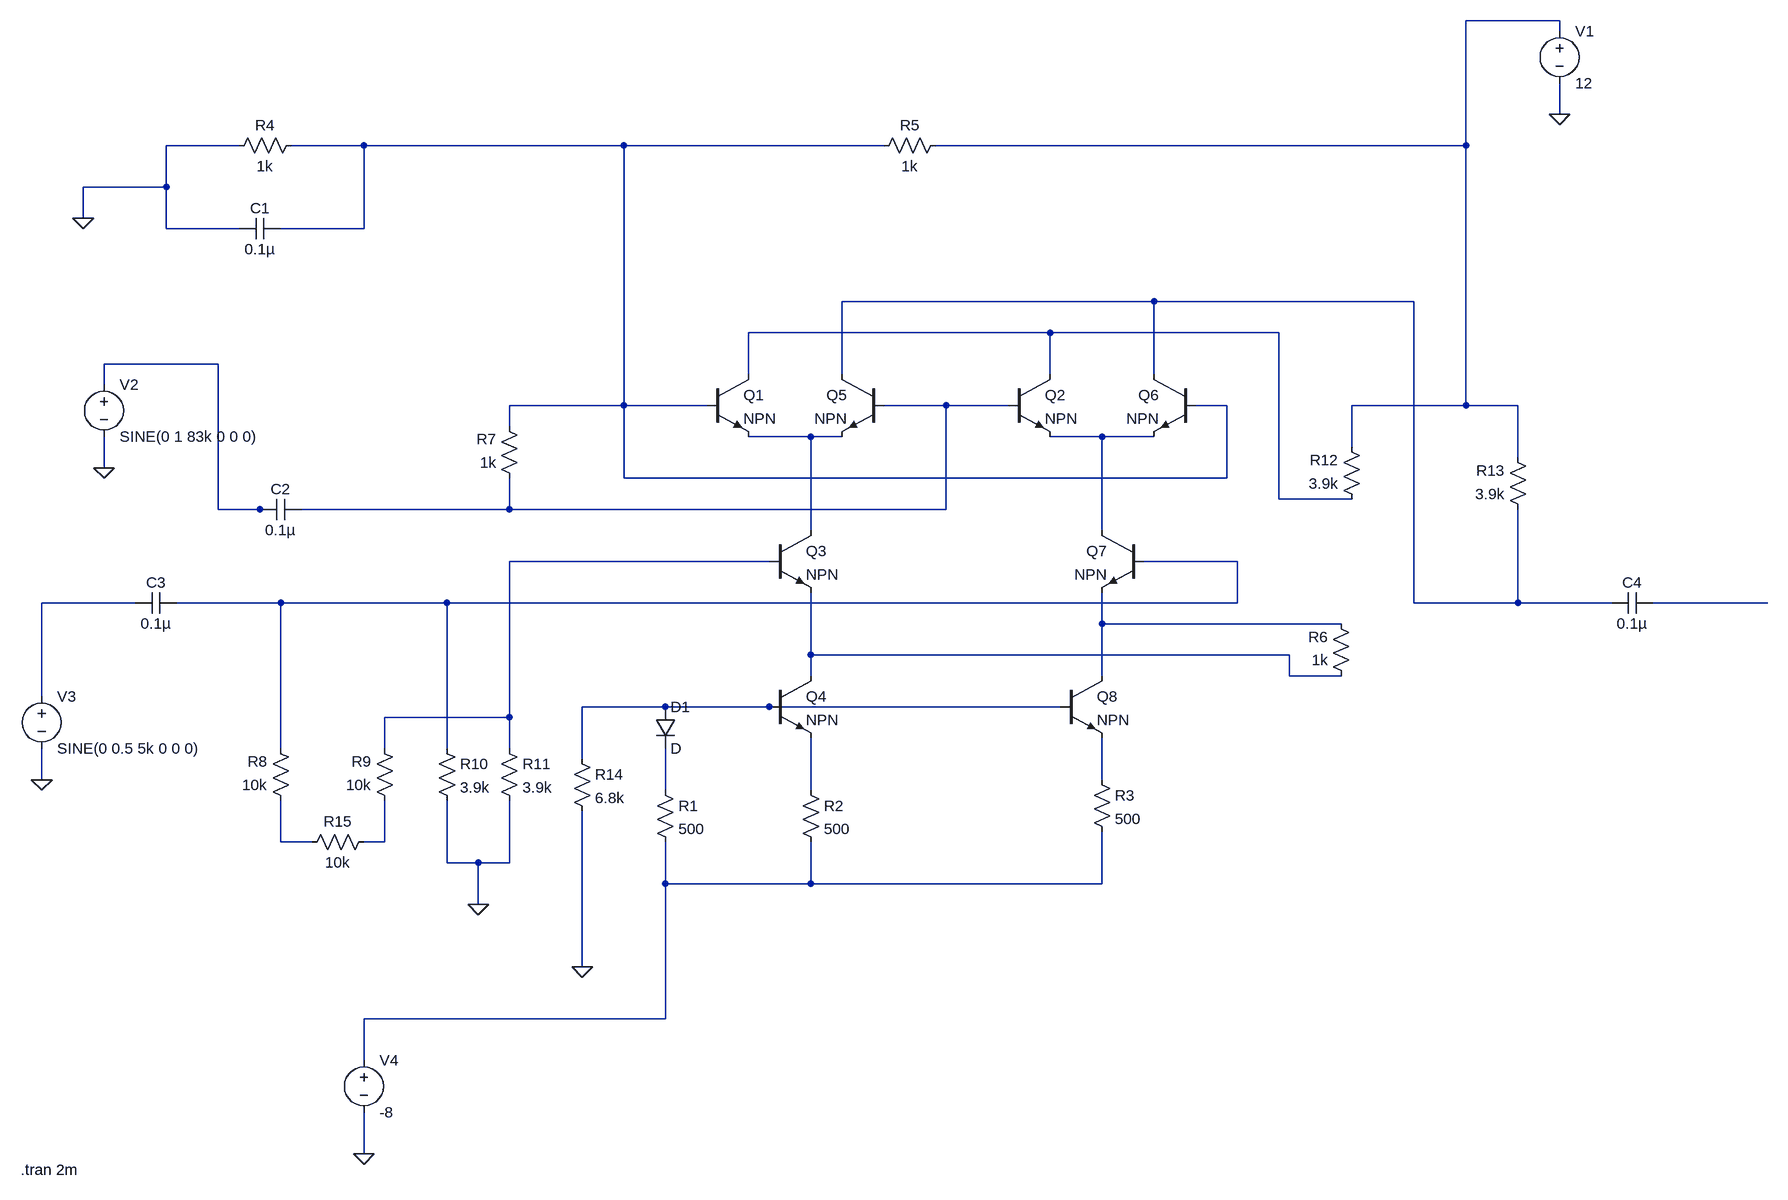
[diagram p0: schematic DSB-SC modulation and demodulation.asc]
DSB-SC modulation and demodulation.asc, the LTspice schematic file:
Version 4.1
SHEET 1 8160 3920
WIRE 1216 -1008 1072 -1008
WIRE 1216 -992 1216 -1008
WIRE 1216 -864 1216 -912
WIRE -816 -816 -928 -816
WIRE -624 -816 -736 -816
WIRE -224 -816 -624 -816
WIRE 176 -816 -224 -816
WIRE 1072 -816 1072 -1008
WIRE 1072 -816 256 -816
WIRE -928 -752 -928 -816
WIRE -928 -752 -1056 -752
WIRE -1056 -704 -1056 -752
WIRE -928 -688 -928 -752
WIRE -816 -688 -928 -688
WIRE -624 -688 -624 -816
WIRE -624 -688 -752 -688
WIRE 592 -576 112 -576
WIRE 992 -576 592 -576
WIRE 432 -528 -32 -528
WIRE 784 -528 432 -528
WIRE -848 -480 -1024 -480
WIRE -32 -464 -32 -528
WIRE 112 -464 112 -576
WIRE 432 -464 432 -528
WIRE 592 -464 592 -576
WIRE -1024 -448 -1024 -480
WIRE -224 -416 -224 -816
WIRE -224 -416 -400 -416
WIRE -96 -416 -224 -416
WIRE 272 -416 176 -416
WIRE 368 -416 272 -416
WIRE 704 -416 656 -416
WIRE 1072 -416 1072 -816
WIRE 1072 -416 896 -416
WIRE 1152 -416 1072 -416
WIRE -400 -384 -400 -416
WIRE 64 -368 -32 -368
WIRE 112 -368 64 -368
WIRE 512 -368 432 -368
WIRE 592 -368 512 -368
WIRE 896 -352 896 -416
WIRE 1152 -336 1152 -416
WIRE -1024 -320 -1024 -368
WIRE -224 -304 -224 -416
WIRE 704 -304 704 -416
WIRE 704 -304 -224 -304
WIRE 784 -272 784 -528
WIRE 896 -272 784 -272
WIRE -848 -256 -848 -480
WIRE -784 -256 -848 -256
WIRE -768 -256 -784 -256
WIRE -400 -256 -400 -304
WIRE -400 -256 -720 -256
WIRE 272 -256 272 -416
WIRE 272 -256 -400 -256
WIRE 64 -224 64 -368
WIRE 512 -224 512 -368
WIRE 0 -176 -400 -176
WIRE 720 -176 576 -176
WIRE -976 -112 -1120 -112
WIRE -752 -112 -912 -112
WIRE -496 -112 -752 -112
WIRE 720 -112 720 -176
WIRE 720 -112 -496 -112
WIRE 992 -112 992 -576
WIRE 1152 -112 1152 -256
WIRE 1152 -112 992 -112
WIRE 1296 -112 1152 -112
WIRE 1536 -112 1360 -112
WIRE 512 -80 512 -128
WIRE 880 -80 512 -80
WIRE 64 -32 64 -128
WIRE 800 -32 64 -32
WIRE 64 0 64 -32
WIRE 512 0 512 -80
WIRE 800 0 800 -32
WIRE 880 0 800 0
WIRE -1120 32 -1120 -112
WIRE -160 48 -288 48
WIRE 0 48 -160 48
WIRE 448 48 0 48
WIRE -400 64 -400 -176
WIRE -400 64 -592 64
WIRE -752 112 -752 -112
WIRE -592 112 -592 64
WIRE -496 112 -496 -112
WIRE -400 112 -400 64
WIRE -288 128 -288 48
WIRE -1120 160 -1120 112
WIRE 512 160 512 96
WIRE -160 176 -160 112
WIRE 64 176 64 96
WIRE -752 256 -752 192
WIRE -704 256 -752 256
WIRE -592 256 -592 192
WIRE -592 256 -624 256
WIRE -496 288 -496 192
WIRE -448 288 -496 288
WIRE -400 288 -400 192
WIRE -400 288 -448 288
WIRE -160 320 -160 256
WIRE 64 320 64 256
WIRE 64 320 -160 320
WIRE 512 320 512 240
WIRE 512 320 64 320
WIRE -448 352 -448 288
WIRE -288 448 -288 208
WIRE -160 528 -160 320
WIRE -160 528 -624 528
WIRE -624 592 -624 528
WIRE -624 736 -624 672
FLAG -288 448 0
FLAG -448 352 0
FLAG 1216 -864 0
FLAG -1024 -320 0
FLAG -1120 160 0
FLAG -1056 -704 0
FLAG -624 736 0
SYMBOL npn -96 -464 R0
SYMATTR InstName Q1
SYMBOL npn 368 -464 R0
SYMATTR InstName Q2
SYMBOL npn 0 -224 R0
SYMATTR InstName Q3
SYMBOL npn 0 0 R0
SYMATTR InstName Q4
SYMBOL npn 176 -464 M0
SYMATTR InstName Q5
SYMBOL npn 656 -464 M0
SYMATTR InstName Q6
SYMBOL npn 576 -224 M0
SYMATTR InstName Q7
SYMBOL diode -176 48 R0
SYMATTR InstName D1
SYMBOL res -176 160 R0
SYMATTR InstName R1
SYMATTR Value 500
SYMBOL res 48 160 R0
SYMATTR InstName R2
SYMATTR Value 500
SYMBOL npn 448 0 R0
SYMATTR InstName Q8
SYMBOL res 496 144 R0
SYMATTR InstName R3
SYMATTR Value 500
SYMBOL res -720 -832 R90
WINDOW 0 0 56 VBottom 2
WINDOW 3 32 56 VTop 2
SYMATTR InstName R4
SYMATTR Value 1k
SYMBOL res 272 -832 R90
WINDOW 0 0 56 VBottom 2
WINDOW 3 32 56 VTop 2
SYMATTR InstName R5
SYMATTR Value 1k
SYMBOL res 896 16 R180
WINDOW 0 36 76 Left 2
WINDOW 3 36 40 Left 2
SYMATTR InstName R6
SYMATTR Value 1k
SYMBOL res -384 -288 R180
WINDOW 0 36 76 Left 2
WINDOW 3 36 40 Left 2
SYMATTR InstName R7
SYMATTR Value 1k
SYMBOL res -736 208 R180
WINDOW 0 36 76 Left 2
WINDOW 3 36 40 Left 2
SYMATTR InstName R8
SYMATTR Value 10k
SYMBOL res -576 208 R180
WINDOW 0 36 76 Left 2
WINDOW 3 36 40 Left 2
SYMATTR InstName R9
SYMATTR Value 10k
SYMBOL res 912 -256 R180
WINDOW 0 36 76 Left 2
WINDOW 3 36 40 Left 2
SYMATTR InstName R12
SYMATTR Value 3.9k
SYMBOL res 1168 -240 R180
WINDOW 0 36 76 Left 2
WINDOW 3 36 40 Left 2
SYMATTR InstName R13
SYMATTR Value 3.9k
SYMBOL cap -752 -704 R90
WINDOW 0 0 32 VBottom 2
WINDOW 3 32 32 VTop 2
SYMATTR InstName C1
SYMATTR Value 0.1µ
SYMBOL cap -720 -272 R90
WINDOW 0 0 32 VBottom 2
WINDOW 3 32 32 VTop 2
SYMATTR InstName C2
SYMATTR Value 0.1µ
SYMBOL cap -912 -128 R90
WINDOW 0 0 32 VBottom 2
WINDOW 3 32 32 VTop 2
SYMATTR InstName C3
SYMATTR Value 0.1µ
SYMBOL cap 1360 -128 R90
WINDOW 0 0 32 VBottom 2
WINDOW 3 32 32 VTop 2
SYMATTR InstName C4
SYMATTR Value 0.1µ
SYMBOL res -304 112 R0
SYMATTR InstName R14
SYMATTR Value 6.8k
SYMBOL res -512 96 R0
SYMATTR InstName R10
SYMATTR Value 3.9k
SYMBOL res -416 96 R0
SYMATTR InstName R11
SYMATTR Value 3.9k
SYMBOL voltage 1216 -1008 R0
WINDOW 123 0 0 Left 0
WINDOW 39 0 0 Left 0
SYMATTR InstName V1
SYMATTR Value 12
SYMBOL voltage -1024 -464 R0
WINDOW 123 0 0 Left 0
WINDOW 39 0 0 Left 0
SYMATTR InstName V2
SYMATTR Value SINE(0 1 83k 0 0 0)
SYMBOL voltage -1120 16 R0
WINDOW 123 0 0 Left 0
WINDOW 39 0 0 Left 0
SYMATTR InstName V3
SYMATTR Value SINE(0 0.5 5k 0 0 0)
SYMBOL res -608 240 R90
WINDOW 0 0 56 VBottom 2
WINDOW 3 32 56 VTop 2
SYMATTR InstName R15
SYMATTR Value 10k
SYMBOL voltage -624 576 R0
WINDOW 123 0 0 Left 0
WINDOW 39 0 0 Left 0
SYMATTR InstName V4
SYMATTR Value -8
TEXT -1152 760 Left 2 !.tran 2m

The netlist it stands for:
* DSB-SC modulation and demodulation.asc
Q1 N004 N002 N007 0 NPN
Q2 N004 N006 N008 0 NPN
Q3 N007 N009 N014 0 NPN
Q4 N014 N015 N018 0 NPN
Q5 N003 N006 N007 0 NPN
Q6 N003 N002 N008 0 NPN
Q7 N008 N010 N013 0 NPN
D1 N015 N017 D
R1 N017 N021 500
R2 N018 N021 500
Q8 N013 N015 N016 0 NPN
R3 N016 N021 500
R4 N002 0 1k
R5 N001 N002 1k
R6 N014 N013 1k
R7 N006 N002 1k
R8 N019 N010 10k
R9 N020 N009 10k
R12 N004 N001 3.9k
R13 N003 N001 3.9k
C1 N002 0 0.1µ
C2 N006 N005 0.1µ
C3 N010 N011 0.1µ
C4 N012 N003 0.1µ
R14 N015 0 6.8k
R10 N010 0 3.9k
R11 N009 0 3.9k
V1 N001 0 12
V2 N005 0 SINE(0 1 83k 0 0 0)
V3 N011 0 SINE(0 0.5 5k 0 0 0)
R15 N020 N019 10k
V4 N021 0 -8
.model D D
.lib standard.dio
.model NPN NPN
.model PNP PNP
.lib standard.bjt
.tran 2m
.backanno
.end